# Altium project Game_Controller.PrjPcb
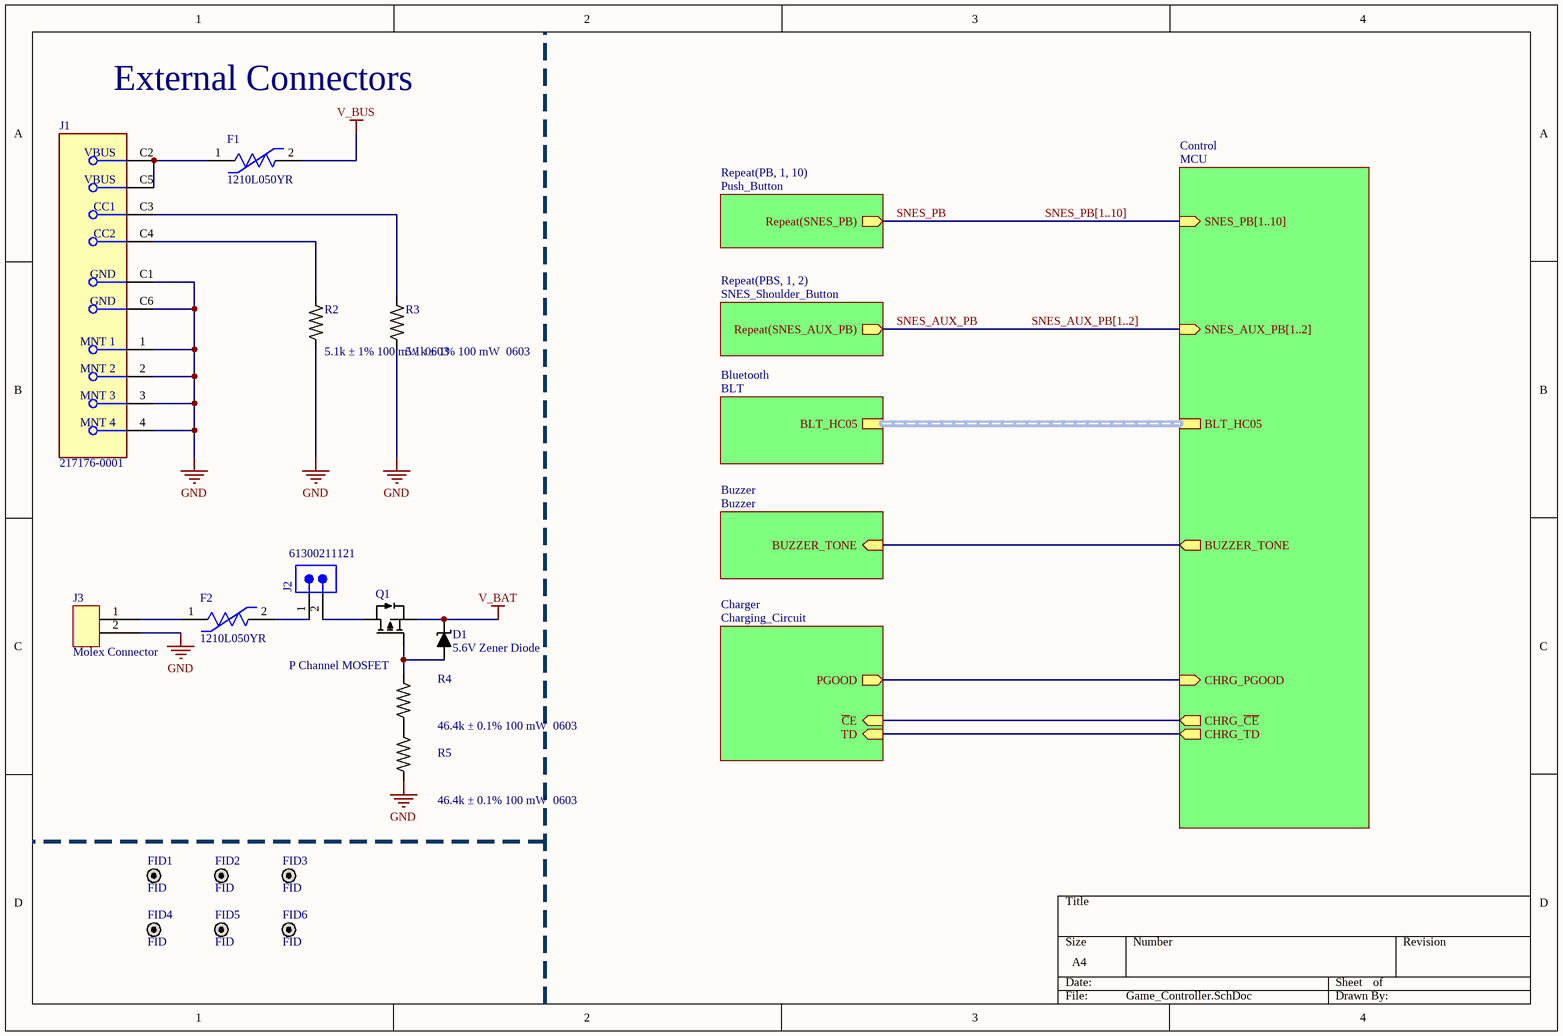
[diagram p0: Game_Controller.SchDoc]
7 sheets, 110 parts. Net scope: hierarchical (ports join the sheet entries above them; power ports are global).
Board file: Game_Controller.PcbDoc
Sheets:
  Game_Controller.SchDoc
    Charger = Charging_Circuit.SchDoc
    PB1 = Push_Button.SchDoc
    PB2 = Push_Button.SchDoc
    PB3 = Push_Button.SchDoc
    PB4 = Push_Button.SchDoc
    PB5 = Push_Button.SchDoc
    PB6 = Push_Button.SchDoc
    PB7 = Push_Button.SchDoc
    PB8 = Push_Button.SchDoc
    PB9 = Push_Button.SchDoc
    PB10 = Push_Button.SchDoc
    Control = MCU.SchDoc
    Bluetooth = BLT.SchDoc
    PBS1 = SNES_Shoulder_Button.SchDoc
    PBS2 = SNES_Shoulder_Button.SchDoc
    Buzzer = Buzzer.SchDoc

## Sheet Game_Controller.SchDoc
size A4; SheetNumber: 1; SheetTotal: 7

### Parts
D1  5.6V Zener Diode  [SOT23-3]
F1  1210L050YR  [FP-1210L050YR-MFG]
F2  1210L050YR  [FP-1210L050YR-MFG]
FID1  FID  [FID]
FID2  FID  [FID]
FID3  FID  [FID]
FID4  FID  [FID]
FID5  FID  [FID]
FID6  FID  [FID]
J1  217176-0001  [FP-217176-0001-MFG]
J2  61300211121  [61300211121]
J3  Molex Connector  [B2B-PH-K-S]
Q1  P Channel MOSFET  [SOT23-3]
R2  5.1k ± 1% / 100 mW / 0603  [0603_RES]
R3  5.1k ± 1% / 100 mW / 0603  [0603_RES]
R4  46.4k ± 0.1% / 100 mW / 0603  [0603_RES]
R5  46.4k ± 0.1% / 100 mW / 0603  [0603_RES]

### Sub-sheets
Bluetooth = BLT: BLT_HC05 (harness BLT_HC05_BUS)
Buzzer = Buzzer: BUZZER_TONE (in)
Charger = Charging_Circuit: ~{C}E (in), TD (in), PGOOD (out)
Control = MCU: BLT_HC05 (harness BLT_HC05_BUS), CHRG_~{CE} (out), CHRG_TD (out), CHRG_PGOOD (in), SNES_PB[1..10] (in), SNES_AUX_PB[1..2] (in), BUZZER_TONE (out)
Repeat(PB, 1, 10) = Push_Button: Repeat(SNES_PB) (out)
Repeat(PBS, 1, 2) = SNES_Shoulder_Button: Repeat(SNES_AUX_PB) (out)

### Nets
GND: J1.1(MNT_1) J1.2(MNT_2) J1.3(MNT_3) J1.4(MNT_4) J1.C1(GND) J1.C6(GND) J3.2 R2.1 R3.1 R5.2
V_BAT: D1.3(K) Q1.2(S)
V_BUS: F1.2
CHRG_~{CE}: sheet Charger/~{C}E, sheet Control/CHRG_~{CE}
CHRG_TD: sheet Charger/TD, sheet Control/CHRG_TD
PGOOD: sheet Charger/PGOOD, sheet Control/CHRG_PGOOD
SNES_AUX_PB: sheet Repeat(PBS, 1, 2)/Repeat(SNES_AUX_PB)
SNES_PB: sheet Repeat(PB, 1, 10)/Repeat(SNES_PB)
NetD1_1: D1.1(A) Q1.1(G) R4.1
NetF1_1: F1.1 J1.C2(VBUS) J1.C5(VBUS)
NetF2_1: F2.1 J3.1
NetF2_2: F2.2 J2.1
NetJ1_C3: J1.C3(CC1) R3.2
NetJ1_C4: J1.C4(CC2) R2.2
NetJ2_2: J2.2 Q1.3(D)
NetQ3_1: sheet Control/BUZZER_TONE, sheet Buzzer/BUZZER_TONE
NetR4_2: R4.2 R5.1

### Buses and harness runs
bus SNES_AUX_PB[1..2] = sheet Control/SNES_AUX_PB[1..2]
bus SNES_PB[1..10] = sheet Control/SNES_PB[1..10]
harness sheet Bluetooth/BLT_HC05 = sheet Control/BLT_HC05

### Notes on the sheet
- External Connectors

### Library data of the parts
D1 = 29: Manufacturer: Vishay; CID: 29; Manufacturer Part Number: BZX84C5V6-E3-08
F1 F2 = CMP-08606-000067-1: PTC RESET FUSE 13.2V 500MA 1210; Approvals: cULus; Resistance: 900mR; Time to Trip: 0.1s; Max Current Rating: 100A; Trip Current: 1A; Max Power Dissipation: 600mW; Case Code (Metric): 3225; Min Operating Temperature: -40°C; Max Voltage Rating (DC): 13.2V; Hold Current: 500mA; Working Voltage: 13.2V; Termination: SMD/SMT; Case Code (Imperial): 1210; Current Rating: 100A; REACH SVHC: No SVHC; Width: 2.8mm; Lead Free: Lead Free; Length: 3.43mm; Voltage Rating (DC): 13.2V; Packaging: Tape and Reel; Terminal Material: Copper; Voltage Rating: 13.2V; Height: 0.85mm; Case/Package: 1210; Package Quantity: 4000; Max Operating Temperature: 85°C; Power Dissipation: 600mW; Operating Supply Voltage: 13.2V
J1 = CMP-04767-000013-1: CONN RCPT TYPE C 24POS SMD RA
J2 = CMP-1712-00002-7: THT Vertical Pin Header WR-PHD, Pitch 2.54 mm, Single Row, 2 pins; Pitch: 2.54mm; Number of Contacts: 2; Connector Type: Male Pin; Gender: Male; Contact Resistance: 20mΩ; Operating Supply Voltage: 250V; Current Rating: 3A; Housing Material: PBT; RoHS: Compliant; Lead Free: Lead Free; Contact Material: Gold; REACH SVHC: No; Min Operating Temperature: -40°C; Termination: Through Hole; Number of Pins: 2; Contact Gender: Male; Packaging: Bulk; Lead Pitch: 2.54mm; Contact Plating: Gold; Orientation: Vertical; Mount: Through Hole; Height: 8.94mm; Color: Black; Number of Positions: 2; Contact Mating Length: 5.9944mm; Max Operating Temperature: 105°C; Voltage Rating: 250V; Number of Rows: 1
J3 = 18: CID: 18; Manufacturer: Molex; Manufacturer Part Number: B2B-PH-K-S
Q1 = 28: Manufacturer: Vishay; CID: 28; Manufacturer Part Number: SI2301CDS-T1-E3
R2 R3 = 17: Manufacturer: Bourns; Manufacturer Part Number: CR0603-FX-5101ELF; CID: 17
R4 R5 = 7: Manufacturer: Yageo; Manufacturer Part Number: RT0603BRD0746K4L; CID: 7

## Sheet Charging_Circuit.SchDoc
size A4; SheetNumber: 5; SheetTotal: 7
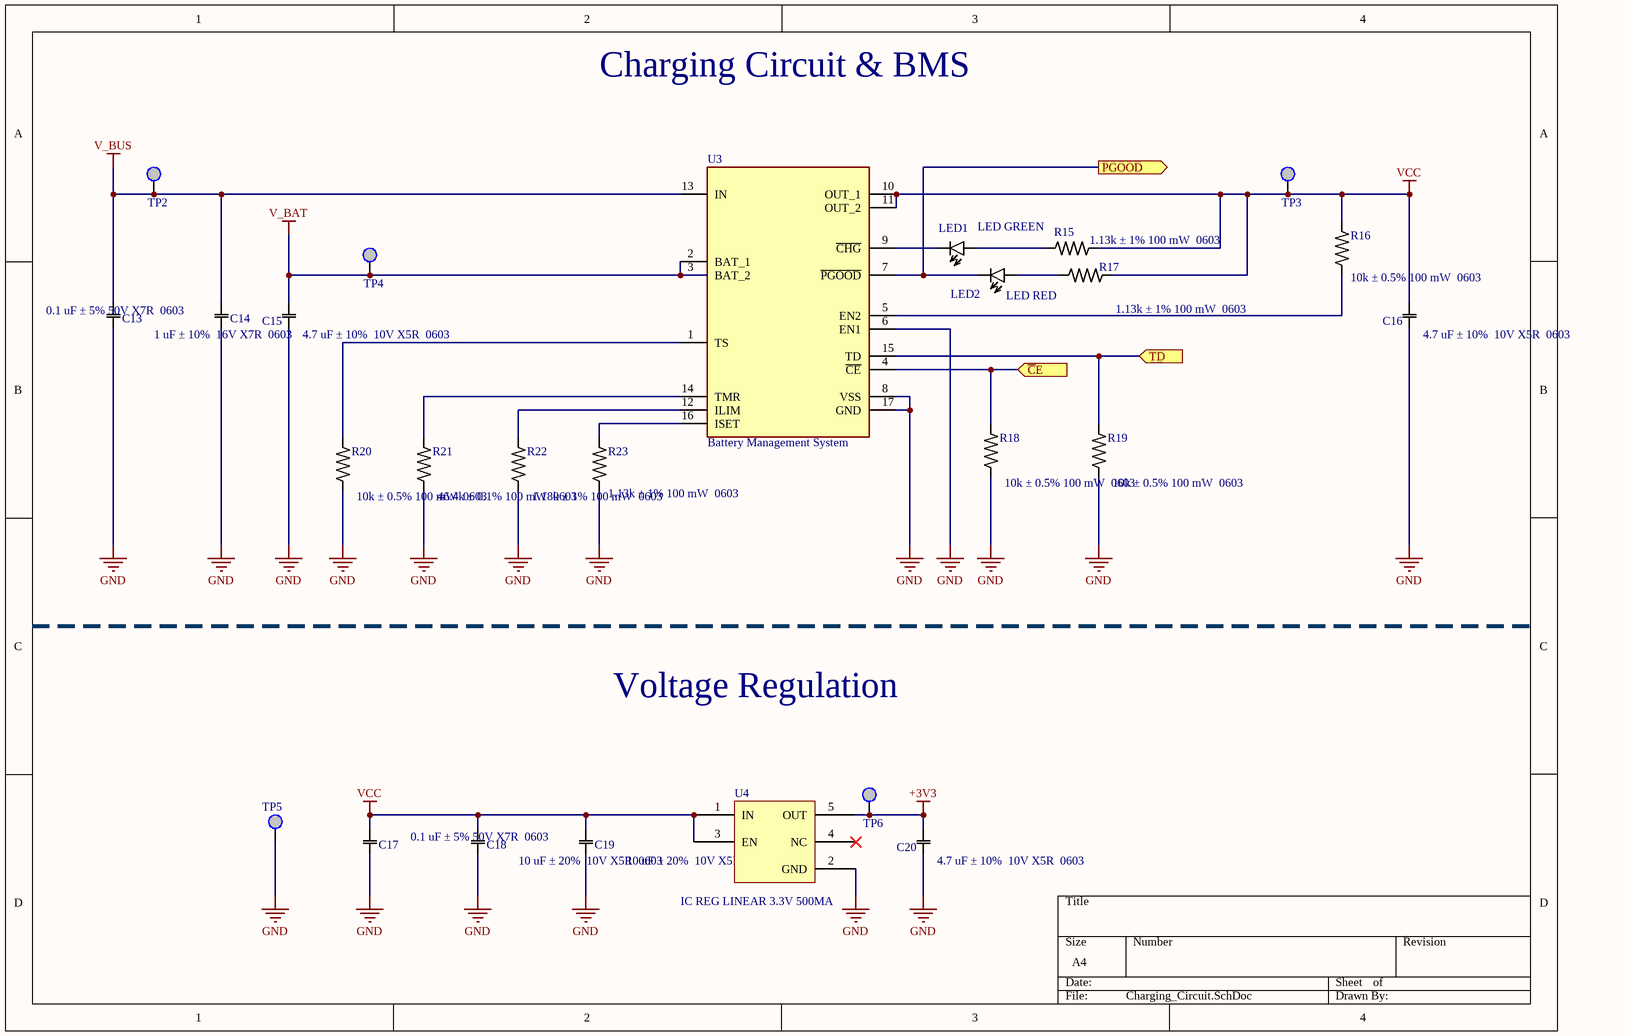
[diagram p1: Charging_Circuit.SchDoc]

### Parts
C13  0.1 uF ± 5% / 50V X7R / 0603  [0603_CAP]
C14  1 uF ± 10% / 16V X7R / 0603  [0603_CAP]
C15  4.7 uF ± 10% / 10V X5R / 0603  [0603_CAP]
C16  4.7 uF ± 10% / 10V X5R / 0603  [0603_CAP]
C17  0.1 uF ± 5% / 50V X7R / 0603  [0603_CAP]
C18  10 uF ± 20% / 10V X5R / 0603  [0603_CAP]
C19  10 uF ± 20% / 10V X5R / 0603  [0603_CAP]
C20  4.7 uF ± 10% / 10V X5R / 0603  [0603_CAP]
LED1  LED GREEN  [LED]
LED2  LED RED  [LED]
R15  1.13k ± 1% / 100 mW / 0603  [0603_RES]
R16  10k ± 0.5% / 100 mW / 0603  [0603_RES]
R17  1.13k ± 1% / 100 mW / 0603  [0603_RES]
R18  10k ± 0.5% / 100 mW / 0603  [0603_RES]
R19  10k ± 0.5% / 100 mW / 0603  [0603_RES]
R20  10k ± 0.5% / 100 mW / 0603  [0603_RES]
R21  46.4k ± 0.1% / 100 mW / 0603  [0603_RES]
R22  1.18k ± 1% / 100 mW / 0603  [0603_RES]
R23  1.13k ± 1% / 100 mW / 0603  [0603_RES]
TP2  TEST POINT  [New footprint 1]  (value not drawn)  (no BOM)
TP3  TEST POINT  [New footprint 1]  (value not drawn)  (no BOM)
TP4  TEST POINT  [New footprint 1]  (value not drawn)  (no BOM)
TP5  TEST POINT  [New footprint 1]  (value not drawn)  (no BOM)
TP6  TEST POINT  [New footprint 1]  (value not drawn)  (no BOM)
U3  Battery Management System  [BQ24074RGTR]
U4  IC REG LINEAR 3.3V 500MA  [SOT23-5]

### Ports
PGOOD (out, see Game_Controller[3C]), TD (in, see Game_Controller[3C]), ~{C}E (in, see Game_Controller[3C])

### Nets
+3V3: C20.1 TP6.0 U4.5(OUT)
GND: C13.2 C14.2 C15.2 C16.2 C17.2 C18.2 C19.2 C20.2 R18.1 R19.1 R20.1 R21.2 R22.1 R23.1 TP5.0 U3.6(EN1) U3.8(VSS) U3.17(GND) U4.2(GND)
V_BAT: C15.1 TP4.0 U3.2(BAT_1) U3.3(BAT_2)
V_BUS: C13.1 C14.1 TP2.0 U3.13(IN)
VCC: C16.1 C17.1 C18.1 C19.1 R15.1 R16.1 R17.1 TP3.0 U3.10(OUT_1) U3.11(OUT_2) U4.1(IN) U4.3(EN)
CHRG_~{CE}: R18.2 U3.4(~{CE}) ; port ~{C}E
CHRG_TD: R19.2 U3.15(TD) ; port TD
PGOOD: LED2.2(K) U3.7(~{PGOOD}) ; port PGOOD
NetLED1_1: LED1.1(A) R15.2
NetLED1_2: LED1.2(K) U3.9(~{CHG})
NetLED2_1: LED2.1(A) R17.2
NetR16_2: R16.2 U3.5(EN2)
NetR20_2: R20.2 U3.1(TS)
NetR21_1: R21.1 U3.14(TMR)
NetR22_2: R22.2 U3.12(ILIM)
NetR23_2: R23.2 U3.16(ISET)

Not connected (* = marked no-connect by the designer): U4 4(NC)*

### Notes on the sheet
- Charging Circuit & BMS
- Voltage Regulation

### Library data of the parts
C13 C17 = 3: Manufacturer: Yageo; Manufacturer Part Number: CC0603JRX7R9BB104; CID: 3
C14 = 5: Manufacturer: Yageo; Manufacturer Part Number: GXT188R71C105KE13D; CID: 5
C15 C16 C20 = 8: Manufacturer: Yageo; Manufacturer Part Number: CC0603KPX5R6BB475; CID: 8
C18 C19 = 14: Manufacturer: Murata; Manufacturer Part Number: GRM188R61A106ME69D; CID: 14
LED1 = 11: Manufacturer: Lite-ON; Manufacturer Part Number: LTST-C190GKT; CID: 11
LED2 = 12: Manufacturer: Lite-ON; Manufacturer Part Number: LTST-C190KRKT; CID: 12
R15 R17 R23 = 10: Manufacturer: Yageo; Manufacturer Part Number: RC0603FR-071K13L; CID: 10
R16 R18-R20 = 6: Manufacturer: Yageo; Manufacturer Part Number: AC0603DRE0710KL; CID: 6
R21 = 7: as R4 on sheet Game_Controller
R22 = 9: Manufacturer: Yageo; Manufacturer Part Number: RC0603FR-071K18L; CID: 9
TP2-TP6 = CMP-008-000007-2: 1mm Test Point
U3 = 2: Manufacturer: Texas Instrument; CID: 2; Manufacturer Part Number: BQ24074RGTR
U4 = 13: Manufacturer: Texas Instrument; CID: 13; Manufacturer Part Number: TLV75533PDBVR

## Sheet Push_Button.SchDoc
size A4; SheetNumber: 2; SheetTotal: 7
Used 10 times, as channels PB1, PB2, PB3, PB4, PB5, PB6, PB7, PB8, PB9, PB10. Parts and nets are listed once, with the designators drawn on the sheet.
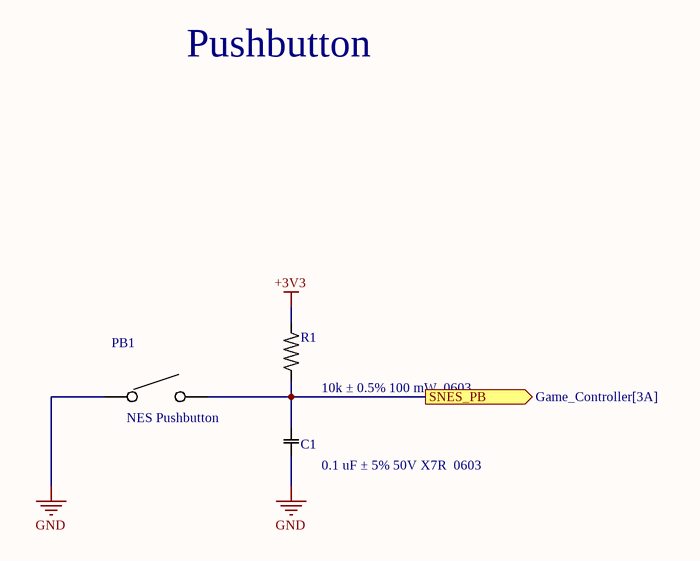
[diagram p2: Push_Button.SchDoc]

### Parts
C1  0.1 uF ± 5% / 50V X7R / 0603  [0603_CAP]
PB1  NES Pushbutton  [SNES_PB]
R1  10k ± 0.5% / 100 mW / 0603  [0603_RES]

### Ports
SNES_PB (out, see Game_Controller[3A])

### Nets
+3V3: R1.2
GND: C1.2 PB1.1
SNES_PB: C1.1 PB1.2 R1.1 ; port SNES_PB

### Channels
PB1: designators end in _PB1; ports SNES_PB=SNES_PB1
PB2: designators end in _PB2; ports SNES_PB=SNES_PB2
PB3: designators end in _PB3; ports SNES_PB=SNES_PB3
PB4: designators end in _PB4; ports SNES_PB=SNES_PB4
PB5: designators end in _PB5; ports SNES_PB=SNES_PB5
PB6: designators end in _PB6; ports SNES_PB=SNES_PB6
PB7: designators end in _PB7; ports SNES_PB=SNES_PB7
PB8: designators end in _PB8; ports SNES_PB=SNES_PB8
PB9: designators end in _PB9; ports SNES_PB=SNES_PB9
PB10: designators end in _PB10; ports SNES_PB=SNES_PB10

### Notes on the sheet
- Pushbutton

### Library data of the parts
C1 = 3: as C13 on sheet Charging_Circuit
PB1 = 15: Manufacturer: Custom; CID: 15; Manufacturer Part Number: Custom
R1 = 6: as R16 on sheet Charging_Circuit

## Sheet MCU.SchDoc
size A4; SheetNumber: 3; SheetTotal: 7
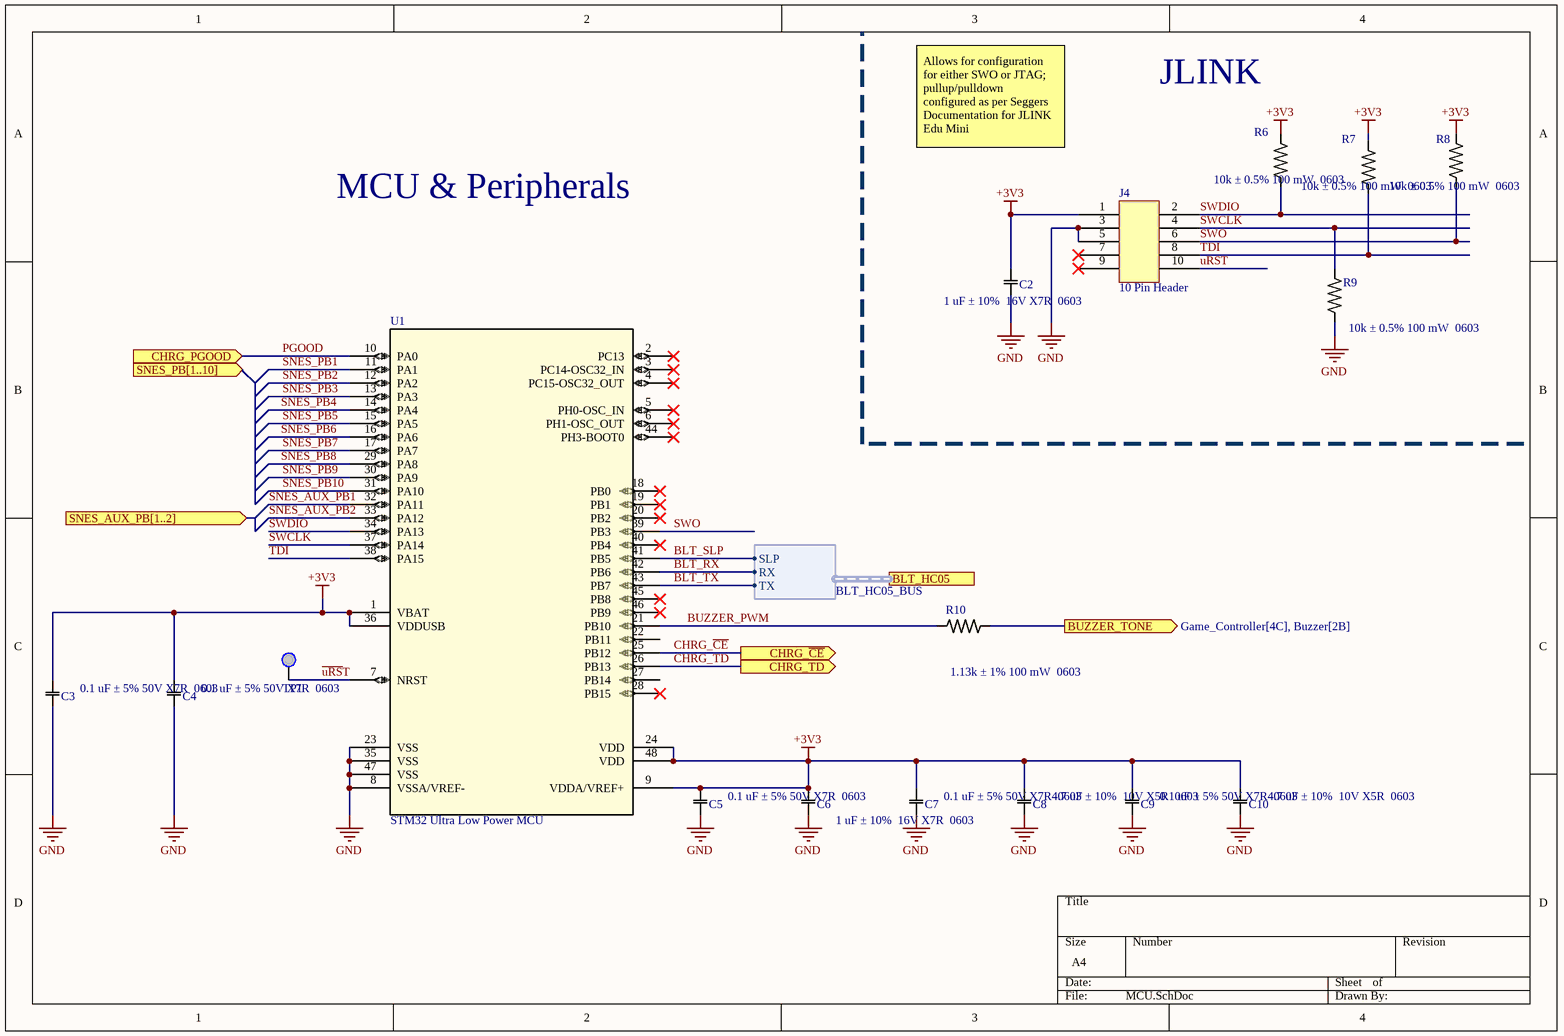
[diagram p3: MCU.SchDoc]

### Parts
C2  1 uF ± 10% / 16V X7R / 0603  [0603_CAP]
C3  0.1 uF ± 5% / 50V X7R / 0603  [0603_CAP]
C4  0.1 uF ± 5% / 50V X7R / 0603  [0603_CAP]
C5  0.1 uF ± 5% / 50V X7R / 0603  [0603_CAP]
C6  1 uF ± 10% / 16V X7R / 0603  [0603_CAP]
C7  0.1 uF ± 5% / 50V X7R / 0603  [0603_CAP]
C8  4.7 uF ± 10% / 10V X5R / 0603  [0603_CAP]
C9  0.1 uF ± 5% / 50V X7R / 0603  [0603_CAP]
C10  4.7 uF ± 10% / 10V X5R / 0603  [0603_CAP]
J4  10 Pin Header  [SHF-105-01-L-D-TH]
R6  10k ± 0.5% / 100 mW / 0603  [0603_RES]
R7  10k ± 0.5% / 100 mW / 0603  [0603_RES]
R8  10k ± 0.5% / 100 mW / 0603  [0603_RES]
R9  10k ± 0.5% / 100 mW / 0603  [0603_RES]
R10  1.13k ± 1% / 100 mW / 0603  [0603_RES]
TP1  TEST POINT  [New footprint 1]  (value not drawn)  (no BOM)
U1  STM32 Ultra Low Power MCU  [LQFP48-7x7mm]

### Ports
BLT_HC05 (harness BLT_HC05_BUS, see Game_Controller[4B], BLT[2B]), BUZZER_TONE (out, see Game_Controller[4C], Buzzer[2B]), CHRG_PGOOD (in, see Game_Controller[4C]), CHRG_TD (out, see Game_Controller[4C]), CHRG_~{CE} (out, see Game_Controller[4C]), SNES_AUX_PB[1..2] (in, see Game_Controller[4B]), SNES_PB[1..10] (in, see Game_Controller[4A])

### Harnesses
BLT_HC05_BUS: RX, TX, SLP

### Nets
+3V3: C2.1 C3.1 C4.1 C5.1 C6.1 C7.1 C8.1 C9.1 C10.1 J4.1 R6.2 R7.2 R8.2 U1.1(VBAT) U1.9(VDDA/VREF+) U1.24(VDD) U1.36(VDDUSB) U1.48(VDD)
GND: C2.2 C3.2 C4.2 C5.2 C6.2 C7.2 C8.2 C9.2 C10.2 J4.3 J4.5 R9.1 U1.8(VSSA/VREF-) U1.23(VSS) U1.35(VSS) U1.47(VSS)
~{uRS}T: J4.10 TP1.0 U1.7(NRST)
BLT_RX: U1.42(PB6) ; port BLT_HC05.RX
BLT_SLP: U1.41(PB5) ; port BLT_HC05.SLP
BLT_TX: U1.43(PB7) ; port BLT_HC05.TX
BUZZER_PWM: R10.2 U1.21(PB10)
CHRG_~{CE}: U1.25(PB12) ; port CHRG_~{CE}
CHRG_TD: U1.26(PB13) ; port CHRG_TD
PGOOD: U1.10(PA0) ; port CHRG_PGOOD
SNES_AUX_PB1: U1.32(PA11)
SNES_AUX_PB2: U1.33(PA12)
SNES_PB1: U1.11(PA1)
SNES_PB2: U1.12(PA2)
SNES_PB3: U1.13(PA3)
SNES_PB4: U1.14(PA4)
SNES_PB5: U1.15(PA5)
SNES_PB6: U1.16(PA6)
SNES_PB7: U1.17(PA7)
SNES_PB8: U1.29(PA8)
SNES_PB9: U1.30(PA9)
SNES_PB10: U1.31(PA10)
SWCLK: J4.4 R9.2 U1.37(PA14)
SWDIO: J4.2 R6.1 U1.34(PA13)
SWO: J4.6 R8.1 U1.39(PB3)
TDI: J4.8 R7.1 U1.38(PA15)
NetQ3_1: R10.1 ; port BUZZER_TONE

Not connected (* = marked no-connect by the designer): J4 7* 9*; U1 2(PC13)* 3(PC14-OSC32_IN)* 4(PC15-OSC32_OUT)* 5(PH0-OSC_IN)* 6(PH1-OSC_OUT)* 18(PB0)* 19(PB1)* 20(PB2)* 22(PB11) 27(PB14) 28(PB15)* 40(PB4)* 44(PH3-BOOT0)* 45(PB8)* 46(PB9)*

### Notes on the sheet
- JLINK
- Allows for configuration for either SWO or JTAG; pullup/pulldown configured as per Seggers Documentation for JLINK Edu Mini
- MCU & Peripherals

### Library data of the parts
C2 C6 = 5: as C14 on sheet Charging_Circuit
C3-C5 C7 C9 = 3: as C13 on sheet Charging_Circuit
C8 C10 = 8: as C15 on sheet Charging_Circuit
J4 = 26: Manufacturer: Samtec; CID: 26; Manufacturer Part Number: SHF-105-01-L-D-TH
R6-R9 = 6: as R16 on sheet Charging_Circuit
R10 = 10: as R15 on sheet Charging_Circuit
TP1 = CMP-008-000007-2: 1mm Test Point
U1 = 25: Manufacturer: ST Electronics; CID: 25; Manufacturer Part Number: STM32L433CCT6

## Sheet BLT.SchDoc
size A4; SheetNumber: 4; SheetTotal: 7
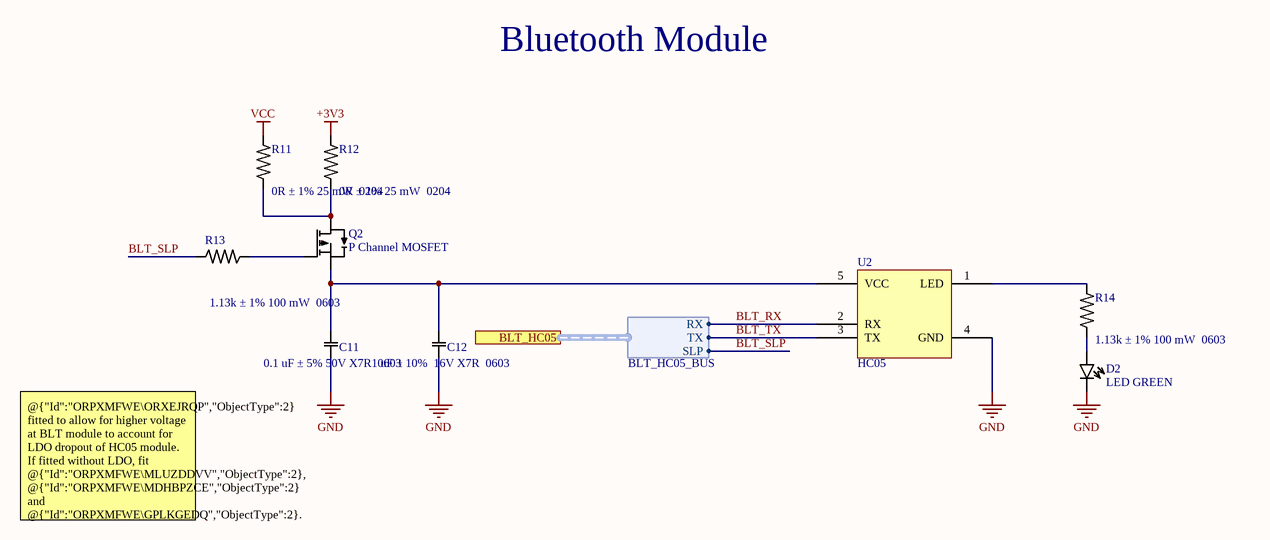
[diagram p4: BLT.SchDoc]

### Parts
C11  0.1 uF ± 5% / 50V X7R / 0603  [0603_CAP]
C12  1 uF ± 10% / 16V X7R / 0603  [0603_CAP]
D2  LED GREEN  [LED]
Q2  P Channel MOSFET  [SOT23-3]
R11  0R ± 1% / 25 mW / 0204  [0603_RES]
R12  0R ± 1% / 25 mW / 0204  [0603_RES]
R13  1.13k ± 1% / 100 mW / 0603  [0603_RES]
R14  1.13k ± 1% / 100 mW / 0603  [0603_RES]
U2  HC05  [HC05]

### Ports
BLT_HC05 (harness BLT_HC05_BUS, see Game_Controller[3B], MCU[3C])

### Harnesses
BLT_HC05_BUS: RX, TX, SLP

### Nets
+3V3: R12.2
GND: C11.2 C12.2 D2.2(K) U2.4(GND)
VCC: R11.2
BLT_RX: U2.2(RX) ; port BLT_HC05.RX
BLT_SLP: R13.2 ; port BLT_HC05.SLP
BLT_TX: U2.3(TX) ; port BLT_HC05.TX
NetC11_1: C11.1 C12.1 Q2.2(S) U2.5(VCC)
NetD2_1: D2.1(A) R14.1
NetQ2_1: Q2.1(G) R13.1
NetQ2_3: Q2.3(D) R11.1 R12.1
NetR14_2: R14.2 U2.1(LED)

### Notes on the sheet
- Bluetooth Module
- @{"Id":"ORPXMFWE\ORXEJRQP","ObjectType":2} fitted to allow for higher voltage at BLT module to account for LDO dropout of HC05 module. If fitted without LDO, fit @{"Id":"ORPXMFWE\MLUZDDVV","ObjectType":2}, @{"Id":"ORPXMFWE\MDHBPZCE","ObjectType":2} and @{"Id":"ORPXMFWE\GPLKGEDQ","ObjectType":2}.

### Library data of the parts
C11 = 3: as C13 on sheet Charging_Circuit
C12 = 5: as C14 on sheet Charging_Circuit
D2 = 11: as LED1 on sheet Charging_Circuit
Q2 = 28: Manufacturer: Vishay; CID: 28; Manufacturer Part Number: SI2301CDS-T1-E3
R11 R12 = 24: Manufacturer: Vishay; Manufacturer Part Number: None; CID: 24
R13 R14 = 10: as R15 on sheet Charging_Circuit
U2 = 19: HC05 Bluetooth Module; Manufacturer: ETSG; CID: 19; Manufacturer Part Number: HC05

## Sheet SNES_Shoulder_Button.SchDoc
size A4; SheetNumber: 6; SheetTotal: 7
Used 2 times, as channels PBS1, PBS2. Parts and nets are listed once, with the designators drawn on the sheet.
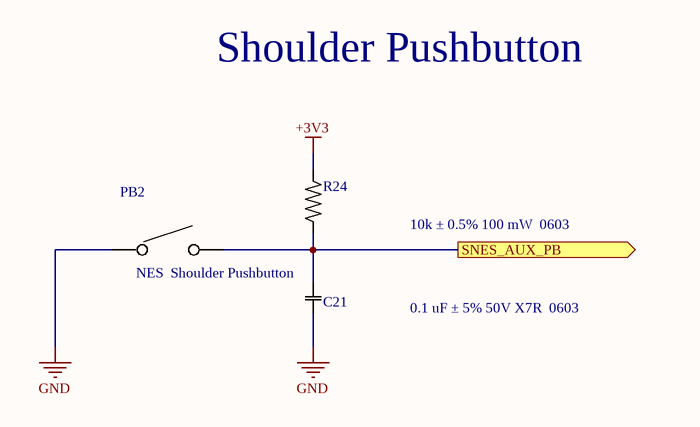
[diagram p5: SNES_Shoulder_Button.SchDoc]

### Parts
C21  0.1 uF ± 5% / 50V X7R / 0603  [0603_CAP]
PB2  NES  Shoulder Pushbutton  [SHOULDER_PB]
R24  10k ± 0.5% / 100 mW / 0603  [0603_RES]

### Ports
SNES_AUX_PB (out, see Game_Controller[3B])

### Nets
+3V3: R24.2
GND: C21.2 PB2.1
SNES_AUX_PB: C21.1 PB2.2 R24.1 ; port SNES_AUX_PB

### Channels
PBS1: designators end in _PBS1; ports SNES_AUX_PB=SNES_AUX_PB1
PBS2: designators end in _PBS2; ports SNES_AUX_PB=SNES_AUX_PB2

### Notes on the sheet
- Shoulder Pushbutton

### Library data of the parts
C21 = 3: as C13 on sheet Charging_Circuit
PB2 = 27: Manufacturer: Custom; CID: 27; Manufacturer Part Number: Custom
R24 = 6: as R16 on sheet Charging_Circuit

## Sheet Buzzer.SchDoc
size A4; SheetNumber: 7; SheetTotal: 7
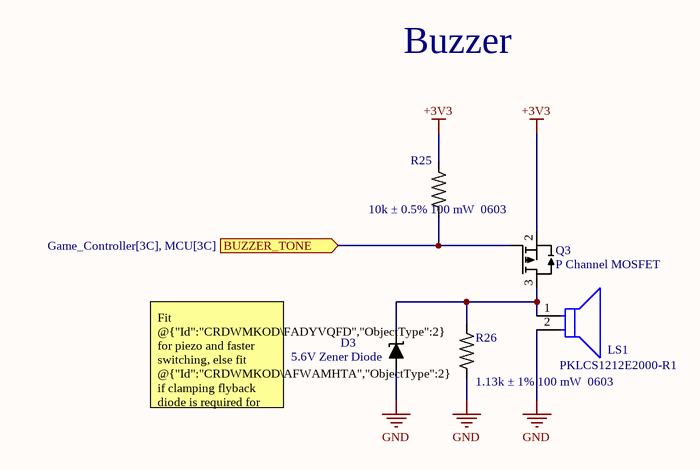
[diagram p6: Buzzer.SchDoc]

### Parts
D3  5.6V Zener Diode  [SOT23-3]
LS1  PKLCS1212E2000-R1  [FP-PKLCS1212E2000-R1-MFG]
Q3  P Channel MOSFET  [SOT23-3]
R25  10k ± 0.5% / 100 mW / 0603  [0603_RES]
R26  1.13k ± 1% / 100 mW / 0603  [0603_RES]

### Ports
BUZZER_TONE (in, see Game_Controller[3C], MCU[3C])

### Nets
+3V3: Q3.2(S) R25.2
GND: D3.1(A) LS1.2 R26.2
NetD3_3: D3.3(K) LS1.1 Q3.3(D) R26.1
NetQ3_1: Q3.1(G) R25.1 ; port BUZZER_TONE

### Notes on the sheet
- Buzzer
- Fit @{"Id":"CRDWMKOD\FADYVQFD","ObjectType":2} for piezo and faster switching, else fit @{"Id":"CRDWMKOD\AFWAMHTA","ObjectType":2} if clamping flyback diode is required for inductive buzzer

### Library data of the parts
D3 = 29: Manufacturer: Vishay; CID: 29; Manufacturer Part Number: BZX84C5V6-E3-08
LS1 = CMP-06202-000001-1: AUDIO PIEZO TRANSDUCER 12.5V SMD; Manufacturer: Murata; Frequency: 2kHz; Description: Buzzers Transducer, Externally Driven Piezo 1.5V  2kHz 70dB @ 1.5V, 10cm Surface Mount Solder Pads; Digikey Description: AUDIO PIEZO TRANSDUCER 12.5V SMD; RoHS: TRUE; Device Class L3: Buzzers; Manufacturer Part Number: PKLCS1212E2000-R1; Automotive: No; Category: Speak; Height: 3mm; Operating Supply Voltage: 12.5V; Mouser Description: Piezo buzzer SMD; Temperature Range High: +70°C; Temperature Range Low: -20°C; ComponentLink2Description: Datasheet; ComponentLink2URL: https://www.murata.com/en-global/products/productdata/8801054425118/SPEC-PKLCS1212E2000-R1.pdf?1517839212000; Package: PKLCS1212E2000-R1; Device Class L1: Electromechanical; Device Class L2: Audio Products; Lead Free: Yes; Temperature: -20°C to +70°C; Octopart: https://octopart.com/pklcs1212e2000-r1-murata-7123179
Q3 = 28: Manufacturer: Vishay; CID: 28; Manufacturer Part Number: SI2301CDS-T1-E3
R25 = 6: as R16 on sheet Charging_Circuit
R26 = 10: as R15 on sheet Charging_Circuit

## Nets that join several sheets
+3V3: Charging_Circuit (C20.1 TP6.0 U4.5), PB1 (R1_PB1.2), PB2 (R1_PB2.2), PB3 (R1_PB3.2), PB4 (R1_PB4.2), PB5 (R1_PB5.2), PB6 (R1_PB6.2), PB7 (R1_PB7.2), PB8 (R1_PB8.2), PB9 (R1_PB9.2), PB10 (R1_PB10.2), MCU (18 pins), BLT (R12.2), PBS1 (R24_PBS1.2), PBS2 (R24_PBS2.2), Buzzer (Q3.2 R25.2)
GND: Game_Controller (10 pins), Charging_Circuit (19 pins), PB1 (C1_PB1.2 PB1_PB1.1), PB2 (C1_PB2.2 PB1_PB2.1), PB3 (C1_PB3.2 PB1_PB3.1), PB4 (C1_PB4.2 PB1_PB4.1), PB5 (C1_PB5.2 PB1_PB5.1), PB6 (C1_PB6.2 PB1_PB6.1), PB7 (C1_PB7.2 PB1_PB7.1), PB8 (C1_PB8.2 PB1_PB8.1), PB9 (C1_PB9.2 PB1_PB9.1), PB10 (C1_PB10.2 PB1_PB10.1), MCU (16 pins), BLT (C11.2 C12.2 D2.2 U2.4), PBS1 (C21_PBS1.2 PB2_PBS1.1), PBS2 (C21_PBS2.2 PB2_PBS2.1), Buzzer (D3.1 LS1.2 R26.2)
V_BAT: Game_Controller (D1.3 Q1.2), Charging_Circuit (C15.1 TP4.0 U3.2 U3.3)
V_BUS: Game_Controller (F1.2), Charging_Circuit (C13.1 C14.1 TP2.0 U3.13)
VCC: Charging_Circuit (12 pins), BLT (R11.2)
BLT_RX: MCU (U1.42), BLT (U2.2)
BLT_SLP: MCU (U1.41), BLT (R13.2)
BLT_TX: MCU (U1.43), BLT (U2.3)
CHRG_~{CE}: Charging_Circuit (R18.2 U3.4), MCU (U1.25)
CHRG_TD: Charging_Circuit (R19.2 U3.15), MCU (U1.26)
NetQ3_1: MCU (R10.1), Buzzer (Q3.1 R25.1)
PGOOD: Charging_Circuit (LED2.2 U3.7), MCU (U1.10)

## Assembly variants
v1: not fitted C2 C11 C12 D2 D3 D4 D5 R12 R14 R15 R17